# Altium schematic sheet GNT604DSPR5.SchDoc
size B
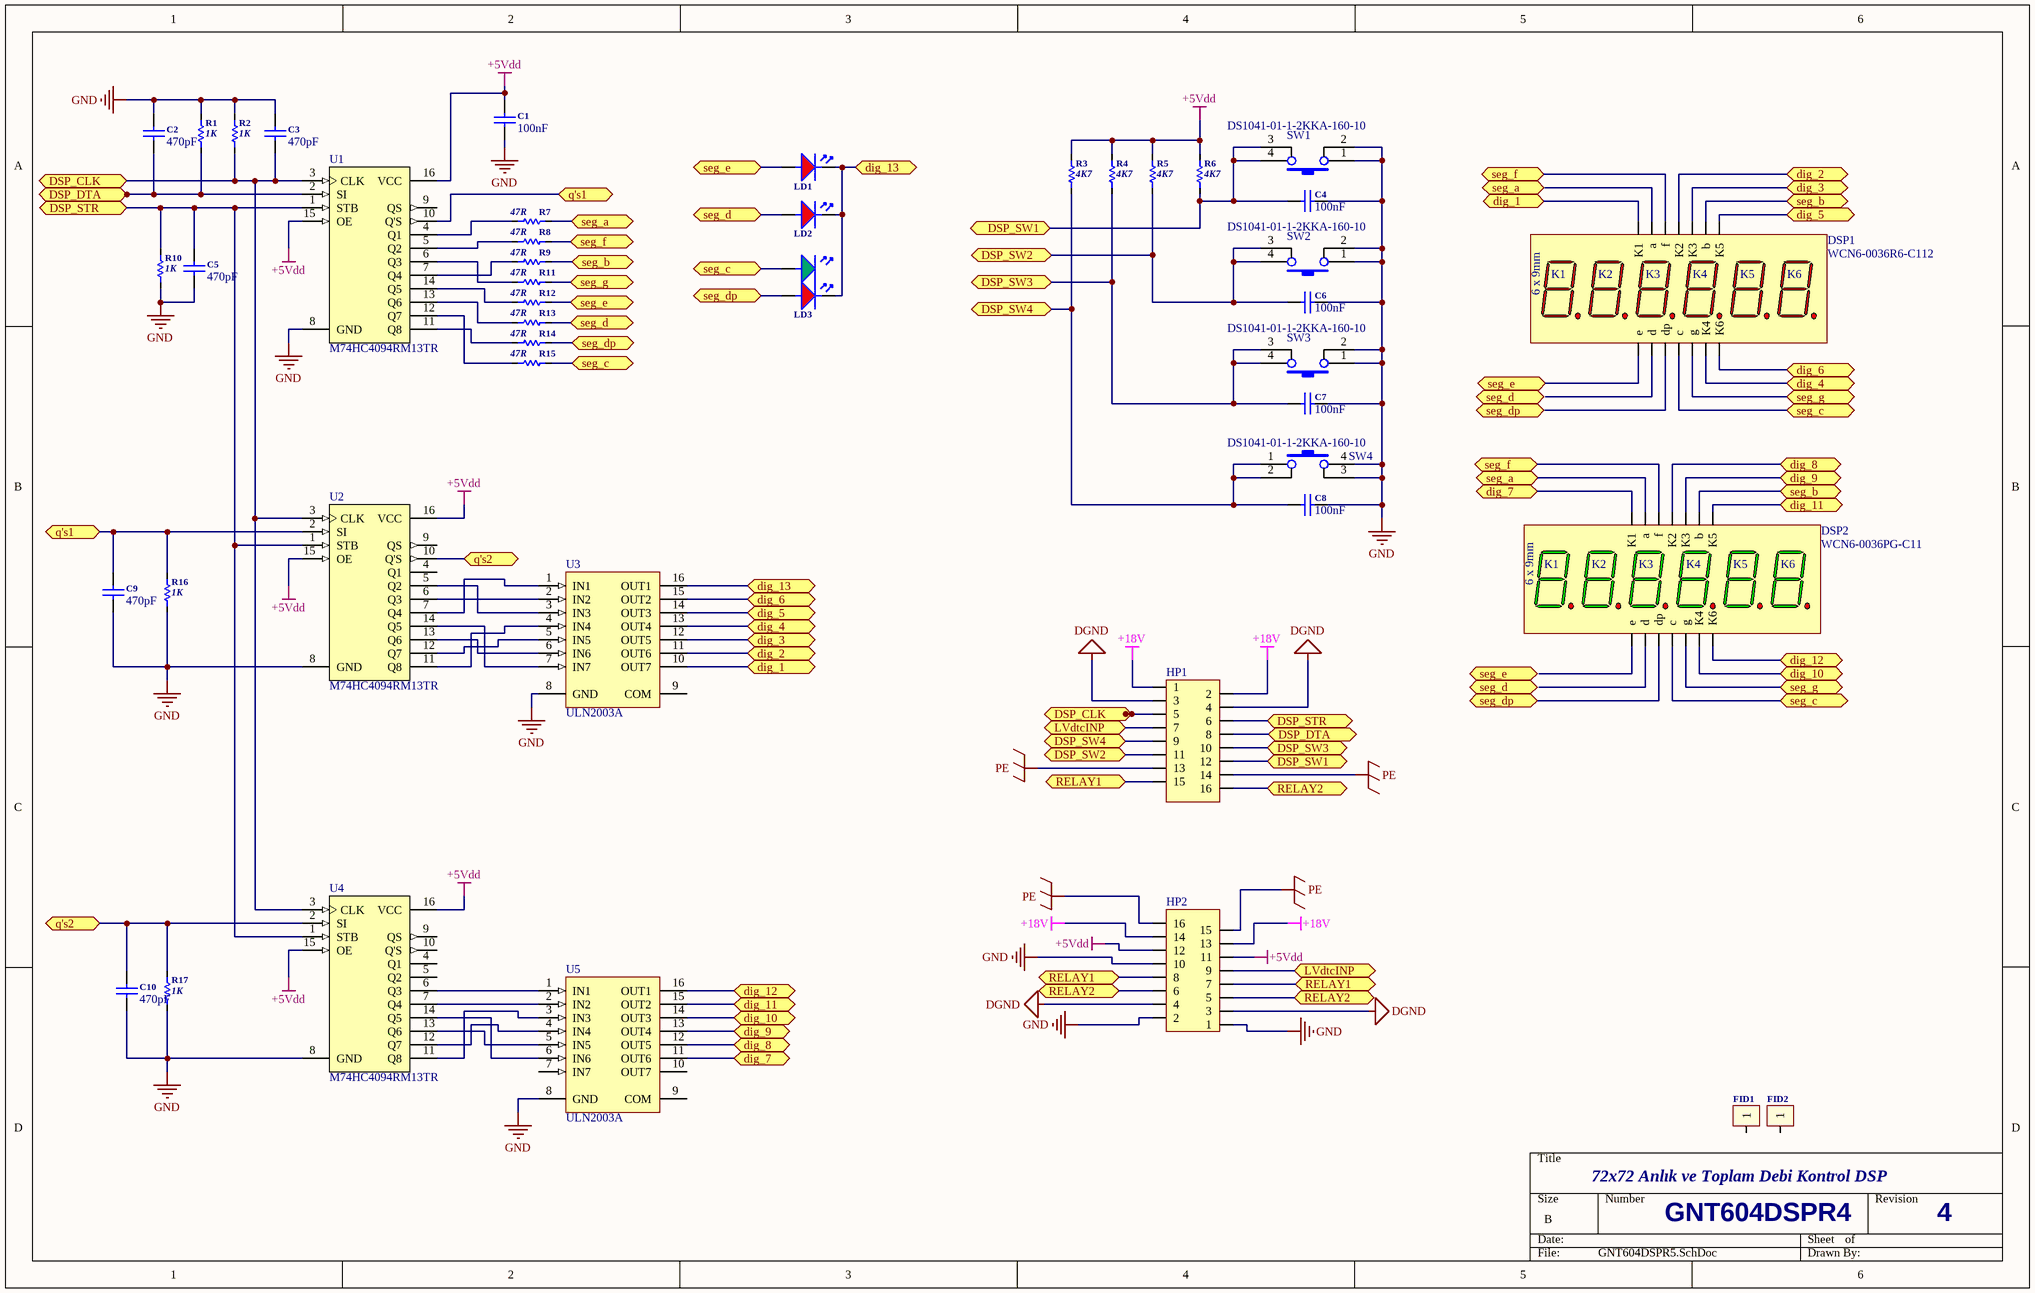
[diagram p0: GNT604DSPR5.SchDoc]

## Parts
C1  100nF  [CC0805]
C2  470pF  [CC0805]
C3  470pF  [CC0805]
C4  100nF  [CC0805]
C5  470pF  [CC0805]
C6  100nF  [CC0805]
C7  100nF  [CC0805]
C8  100nF  [CC0805]
C9  470pF  [CC0805]
C10  470pF  [CC0805]
DSP1  WCN6-0036R6-C112  [WCN6-0036XX]
DSP2  WCN6-0036PG-C11  [WCN6-0036XX]
FID1  FIDUCIAL1  [FIDUCIAL1]  (value not drawn)
FID2  FIDUCIAL1  [FIDUCIAL1]  (value not drawn)
HP1  DS1015-07_CONFLY  [HeaderAntenk180Pin16]  (value not drawn)
HP2  DS1015-07_CONFLY  [HeaderAntenk180Pin16]  (value not drawn)
LD1  Led  [LED_3MM]  (value not drawn)
LD2  Led  [LED_3MM]  (value not drawn)
LD3  Led_dual  [LEDDUAL_3MM]  (value not drawn)
R1  1K  [CR0805]
R2  1K  [CR0805]
R3  4K7  [CR0805]
R4  4K7  [CR0805]
R5  4K7  [CR0805]
R6  4K7  [CR0805]
R7  47R  [CR0805]
R8  47R  [CR0805]
R9  47R  [CR0805]
R10  1K  [CR0805]
R11  47R  [CR0805]
R12  47R  [CR0805]
R13  47R  [CR0805]
R14  47R  [CR0805]
R15  47R  [CR0805]
R16  1K  [CR0805]
R17  1K  [CR0805]
SW1  DS1041-01-1-2KKA-160-10  [SW4 DIP6X6]
SW2  DS1041-01-1-2KKA-160-10  [SW4 DIP6X6]
SW3  DS1041-01-1-2KKA-160-10  [SW4 DIP6X6]
SW4  DS1041-01-1-2KKA-160-10  [SW4 DIP6X6]
U1  M74HC4094RM13TR  [SO-16]
U2  M74HC4094RM13TR  [SO-16]
U3  ULN2003A  [SO-16]
U4  M74HC4094RM13TR  [SO-16]
U5  ULN2003A  [SO-16]

## Ports
dig_1 (bidir), dig_2 (bidir), dig_3 (bidir), dig_4 (bidir), dig_5 (bidir), dig_6 (bidir), dig_7 (bidir), dig_8 (bidir), dig_9 (bidir), dig_10 (bidir), dig_11 (bidir), dig_12 (bidir), dig_13 (bidir), DSP_CLK (bidir), DSP_DTA (bidir), DSP_STR (bidir), DSP_SW1 (bidir), DSP_SW2 (bidir), DSP_SW3 (bidir), DSP_SW4 (bidir), LVdtcINP (bidir), q's1 (bidir), q's2 (bidir), RELAY1 (bidir), RELAY2 (bidir), seg_a (bidir), seg_b (bidir), seg_c (bidir), seg_d (bidir), seg_dp (bidir), seg_e (bidir), seg_f (bidir), seg_g (bidir)

## Nets
+5Vdd: C1.2 HP2.11 HP2.12 R3.1 R4.1 R5.1 R6.1 U1.15(OE) U1.16(VCC) U2.15(OE) U2.16(VCC) U4.15(OE) U4.16(VCC)
+18V: HP1.1 HP1.2 HP2.13 HP2.14
DGND: HP1.3 HP1.4 HP2.3 HP2.4
GND: C1.1 C2.2 C3.2 C4.1 C5.1 C6.1 C7.1 C8.1 C9.1 C10.1 HP2.1 HP2.2 HP2.10 R1.1 R2.1 R10.2 R16.2 R17.2 SW1.1 SW1.2 SW2.1 SW2.2 SW3.1 SW3.2 SW4.3 SW4.4 U1.8(GND) U2.8(GND) U3.8(GND) U4.8(GND) U5.8(GND)
PE: HP1.13 HP1.14 HP2.15 HP2.16
dig_1: DSP1.14(K1) U3.10(OUT7) ; port dig_1
dig_2: DSP1.11(K2) U3.11(OUT6) ; port dig_2
dig_3: DSP1.10(K3) U3.12(OUT5) ; port dig_3
dig_4: DSP1.6(K4) U3.13(OUT4) ; port dig_4
dig_5: DSP1.8(K5) U3.14(OUT3) ; port dig_5
dig_6: DSP1.7(K6) U3.15(OUT2) ; port dig_6
dig_7: DSP2.14(K1) U5.11(OUT6) ; port dig_7
dig_8: DSP2.11(K2) U5.12(OUT5) ; port dig_8
dig_9: DSP2.10(K3) U5.13(OUT4) ; port dig_9
dig_10: DSP2.6(K4) U5.14(OUT3) ; port dig_10
dig_11: DSP2.8(K5) U5.15(OUT2) ; port dig_11
dig_12: DSP2.7(K6) U5.16(OUT1) ; port dig_12
dig_13: LD1.2(K) LD2.2(K) LD3.2(K1K2) U3.16(OUT1) ; port dig_13
DSP_CLK: C3.1 HP1.5 R2.2 U1.3(CLK) U2.3(CLK) U4.3(CLK) ; port DSP_CLK
DSP_DTA: C2.1 HP1.8 R1.2 U1.2(SI) ; port DSP_DTA
DSP_STR: C5.2 HP1.6 R10.1 U1.1(STB) U2.1(STB) U4.1(STB) ; port DSP_STR
DSP_SW1: C4.2 HP1.12 R6.2 SW1.3 SW1.4 ; port DSP_SW1
DSP_SW2: C6.2 HP1.11 R5.2 SW2.3 SW2.4 ; port DSP_SW2
DSP_SW3: C7.2 HP1.10 R4.2 SW3.3 SW3.4 ; port DSP_SW3
DSP_SW4: C8.2 HP1.9 R3.2 SW4.1 SW4.2 ; port DSP_SW4
LVdtcINP: HP1.7 HP2.9 ; port LVdtcINP
q's1: C9.2 R16.1 U1.10(Q'S) U2.2(SI) ; port q's1
q's2: C10.2 R17.1 U2.10(Q'S) U4.2(SI) ; port q's2
RELAY1: HP1.15 HP2.7 HP2.8 ; port RELAY1
RELAY2: HP1.16 HP2.5 HP2.6 ; port RELAY2
seg_a: DSP2.13(a) R7.2 ; port seg_a
seg_b: DSP1.9(b) DSP2.9(b) R9.2 ; port seg_b
seg_c: DSP1.4(c) DSP2.4(c) LD3.3(A2) R15.2 ; port seg_c
seg_d: LD2.1(A) R13.2 ; port seg_d
seg_dp: LD3.1(A1) R14.2 ; port seg_dp
seg_e: DSP1.1(e) LD1.1(A) R12.2 ; port seg_e
seg_f: DSP1.12(f) DSP2.12(f) R8.2 ; port seg_f
seg_g: DSP1.5(g) DSP2.5(g) R11.2 ; port seg_g
NetR7_1: R7.1 U1.4(Q1)
NetR8_1: R8.1 U1.5(Q2)
NetR9_1: R9.1 U1.7(Q4)
NetR11_1: R11.1 U1.6(Q3)
NetR12_1: R12.1 U1.14(Q5)
NetR13_1: R13.1 U1.13(Q6)
NetR14_1: R14.1 U1.11(Q8)
NetR15_1: R15.1 U1.12(Q7)
NetU2_5: U2.5(Q2) U3.3(IN3)
NetU2_6: U2.6(Q3) U3.2(IN2)
NetU2_7: U2.7(Q4) U3.1(IN1)
NetU2_11: U2.11(Q8) U3.4(IN4)
NetU2_12: U2.12(Q7) U3.5(IN5)
NetU2_13: U2.13(Q6) U3.6(IN6)
NetU2_14: U2.14(Q5) U3.7(IN7)
NetU4_6: U4.6(Q3) U5.1(IN1)
NetU4_7: U4.7(Q4) U5.2(IN2)
NetU4_11: U4.11(Q8) U5.3(IN3)
NetU4_12: U4.12(Q7) U5.4(IN4)
NetU4_13: U4.13(Q6) U5.5(IN5)
NetU4_14: U4.14(Q5) U5.6(IN6)

Not connected (* = marked no-connect by the designer): DSP1 2(d) 3(dp) 13(a); DSP2 1(e) 2(d) 3(dp); FID1 1; FID2 1; U1 9(QS); U2 4(Q1) 9(QS); U3 9(COM); U4 4(Q1) 5(Q2) 9(QS) 10(Q'S); U5 7(IN7) 9(COM) 10(OUT7)

## Notes on the sheet
- 72x72 Anlık ve Toplam Debi Kontrol DSP
- GNT604DSPR4
- 4
- (in symbol DSP WCN6-0036PG-C11) 6 x 9mm
- (in symbol DSP WCN6-0036XX-C11) 6 x 9mm

## Library data of the parts
C1-C10 = CC-0805: Ceramic Chip Capacitor - Standard
DSP1 = DSP WCN6-0036XX-C11: LED DISPLAY 7 SEGMENT 6DIGIT 9.2MM (-) RED; Part Number: CN6-0036R6-C112
DSP2 = DSP WCN6-0036PG-C11: LED DISPLAY 9,20MM 6DIGIT (-) ULTRA GREEN; Part Number: DSP WCN6-0036PG-C11
HP1 HP2 = Header Antenk180PinM16: Header, 16-Pin, 180 DEGREES; Revision: 17-Jul-2002: Re-released for DXP Platform.; Publisher: Altium Limited
LD1 LD2 = LED3MM: Led 3mm - RED
LD3 = LED3MM_DUAL: Led 3mm dual - RED-GREEN
R1-R17 = CR-0805: ChipResistor0805; Published: 8-Jun-2000; LatestRevisionDate: 17-Jul-2002; LatestRevisionNote: Re-released for DXP Platform.; PackageReference: AXIAL-0.3; Publisher: Altium Limited
SW1-SW4 = SW4 DIP6X6: TACHT SWITCH DIP6X6
U1 U2 U4 = M74HC4094RM13TR: 8 Bit SIPO Shift Latch Register (3-State); Published: 8-Jun-2000; LatestRevisionDate: 6-Jun-2005; LatestRevisionNote: Stylized 3D Model Added.; DatasheetDocument: Feb-1993; PackageDocument: May-1998; PackageReference: SO16; Publisher: Altium Limited; ComponentLink1Description: Manufacturer Link; ComponentLink1URL: http://www.st.com/; ComponentLink2Description: Datasheet; ComponentLink2URL: http://www.st.com/stonline/products/literature/ds/1972/m74hc4094.pdf
U3 U5 = ULN2003A: Seven Darlington Array; Published: 8-Jun-2000; LatestRevisionDate: 13-Apr-2006; LatestRevisionNote: IPC-7351 Footprint Added.; DatasheetVersion: Sep-1998; PackageVersion: May-1998; PackageReference: SO16; Publisher: Altium Limited; PackageDescription: 16-Pin Small Outline Integrated Circuit 1.27 mm Pitch; Code_IPC: SOIC127P600-16; ComponentLink1Description: Manufacturer Link; ComponentLink1URL: http://www.st.com/; ComponentLink2Description: Datasheet; ComponentLink2URL: http://www.st.com/stonline/products/literature/ds/5279/uln2001.pdf